# Altium project ASCII-v1.2.PrjPcb (part 1 of 3)
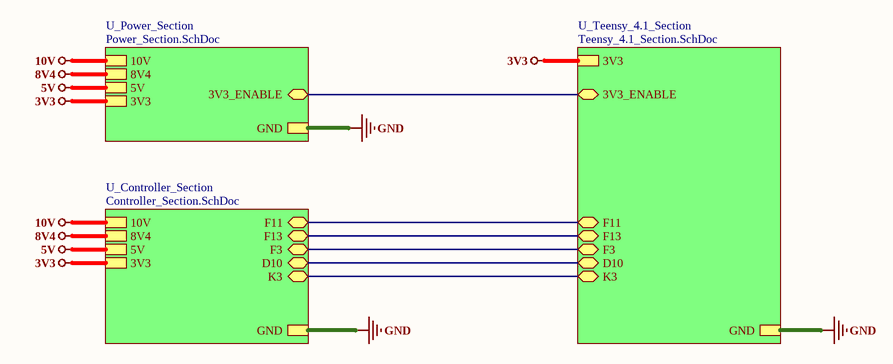
[diagram p0: Top_Section.SchDoc]
4 sheets, 189 parts. Net scope: hierarchical (ports join the sheet entries above them; power ports are global).
Board file: ASCII-v1.2.PcbDoc
Sheets:
  Top_Section.SchDoc
    U_Power_Section = Power_Section.SchDoc
    U_Controller_Section = Controller_Section.SchDoc
    U_Teensy_4.1_Section = Teensy_4.1_Section.SchDoc

## Sheet Top_Section.SchDoc
size 420 x 297 mm; SheetNumber: 1; SheetTotal: 4

### Sub-sheets
U_Controller_Section = Controller_Section.SchDoc: 8V4, GND, 10V, 5V, 3V3, F11 (bidir), F13 (bidir), F3 (bidir), D10 (bidir), K3 (bidir)
U_Power_Section = Power_Section.SchDoc: 8V4, GND, 10V, 5V, 3V3, 3V3_ENABLE (bidir)
U_Teensy_4.1_Section = Teensy_4.1_Section.SchDoc: GND, 3V3, 3V3_ENABLE (bidir), F11 (bidir), F13 (bidir), F3 (bidir), D10 (bidir), K3 (bidir)

### Nets
3V3: sheet U_Power_Section/3V3, sheet U_Controller_Section/3V3, sheet U_Teensy_4.1_Section/3V3
5V: sheet U_Power_Section/5V, sheet U_Controller_Section/5V
8V4: sheet U_Power_Section/8V4, sheet U_Controller_Section/8V4
10V: sheet U_Power_Section/10V, sheet U_Controller_Section/10V  [project net S-]
GND: sheet U_Power_Section/GND, sheet U_Controller_Section/GND, sheet U_Teensy_4.1_Section/GND
3V3_ENABLE: sheet U_Power_Section/3V3_ENABLE, sheet U_Teensy_4.1_Section/3V3_ENABLE
D10: sheet U_Controller_Section/D10, sheet U_Teensy_4.1_Section/D10
F3: sheet U_Controller_Section/F3, sheet U_Teensy_4.1_Section/F3
F11: sheet U_Controller_Section/F11, sheet U_Teensy_4.1_Section/F11
F13: sheet U_Controller_Section/F13, sheet U_Teensy_4.1_Section/F13
K3: sheet U_Controller_Section/K3, sheet U_Teensy_4.1_Section/K3

### Notes on the sheet
- File:
- Title:
- Date:
- Page
- Num:
- Total:
- Drawn By: Huzaifa Ali

## Sheet Power_Section.SchDoc
size 420 x 297 mm; SheetNumber: 3; SheetTotal: 4
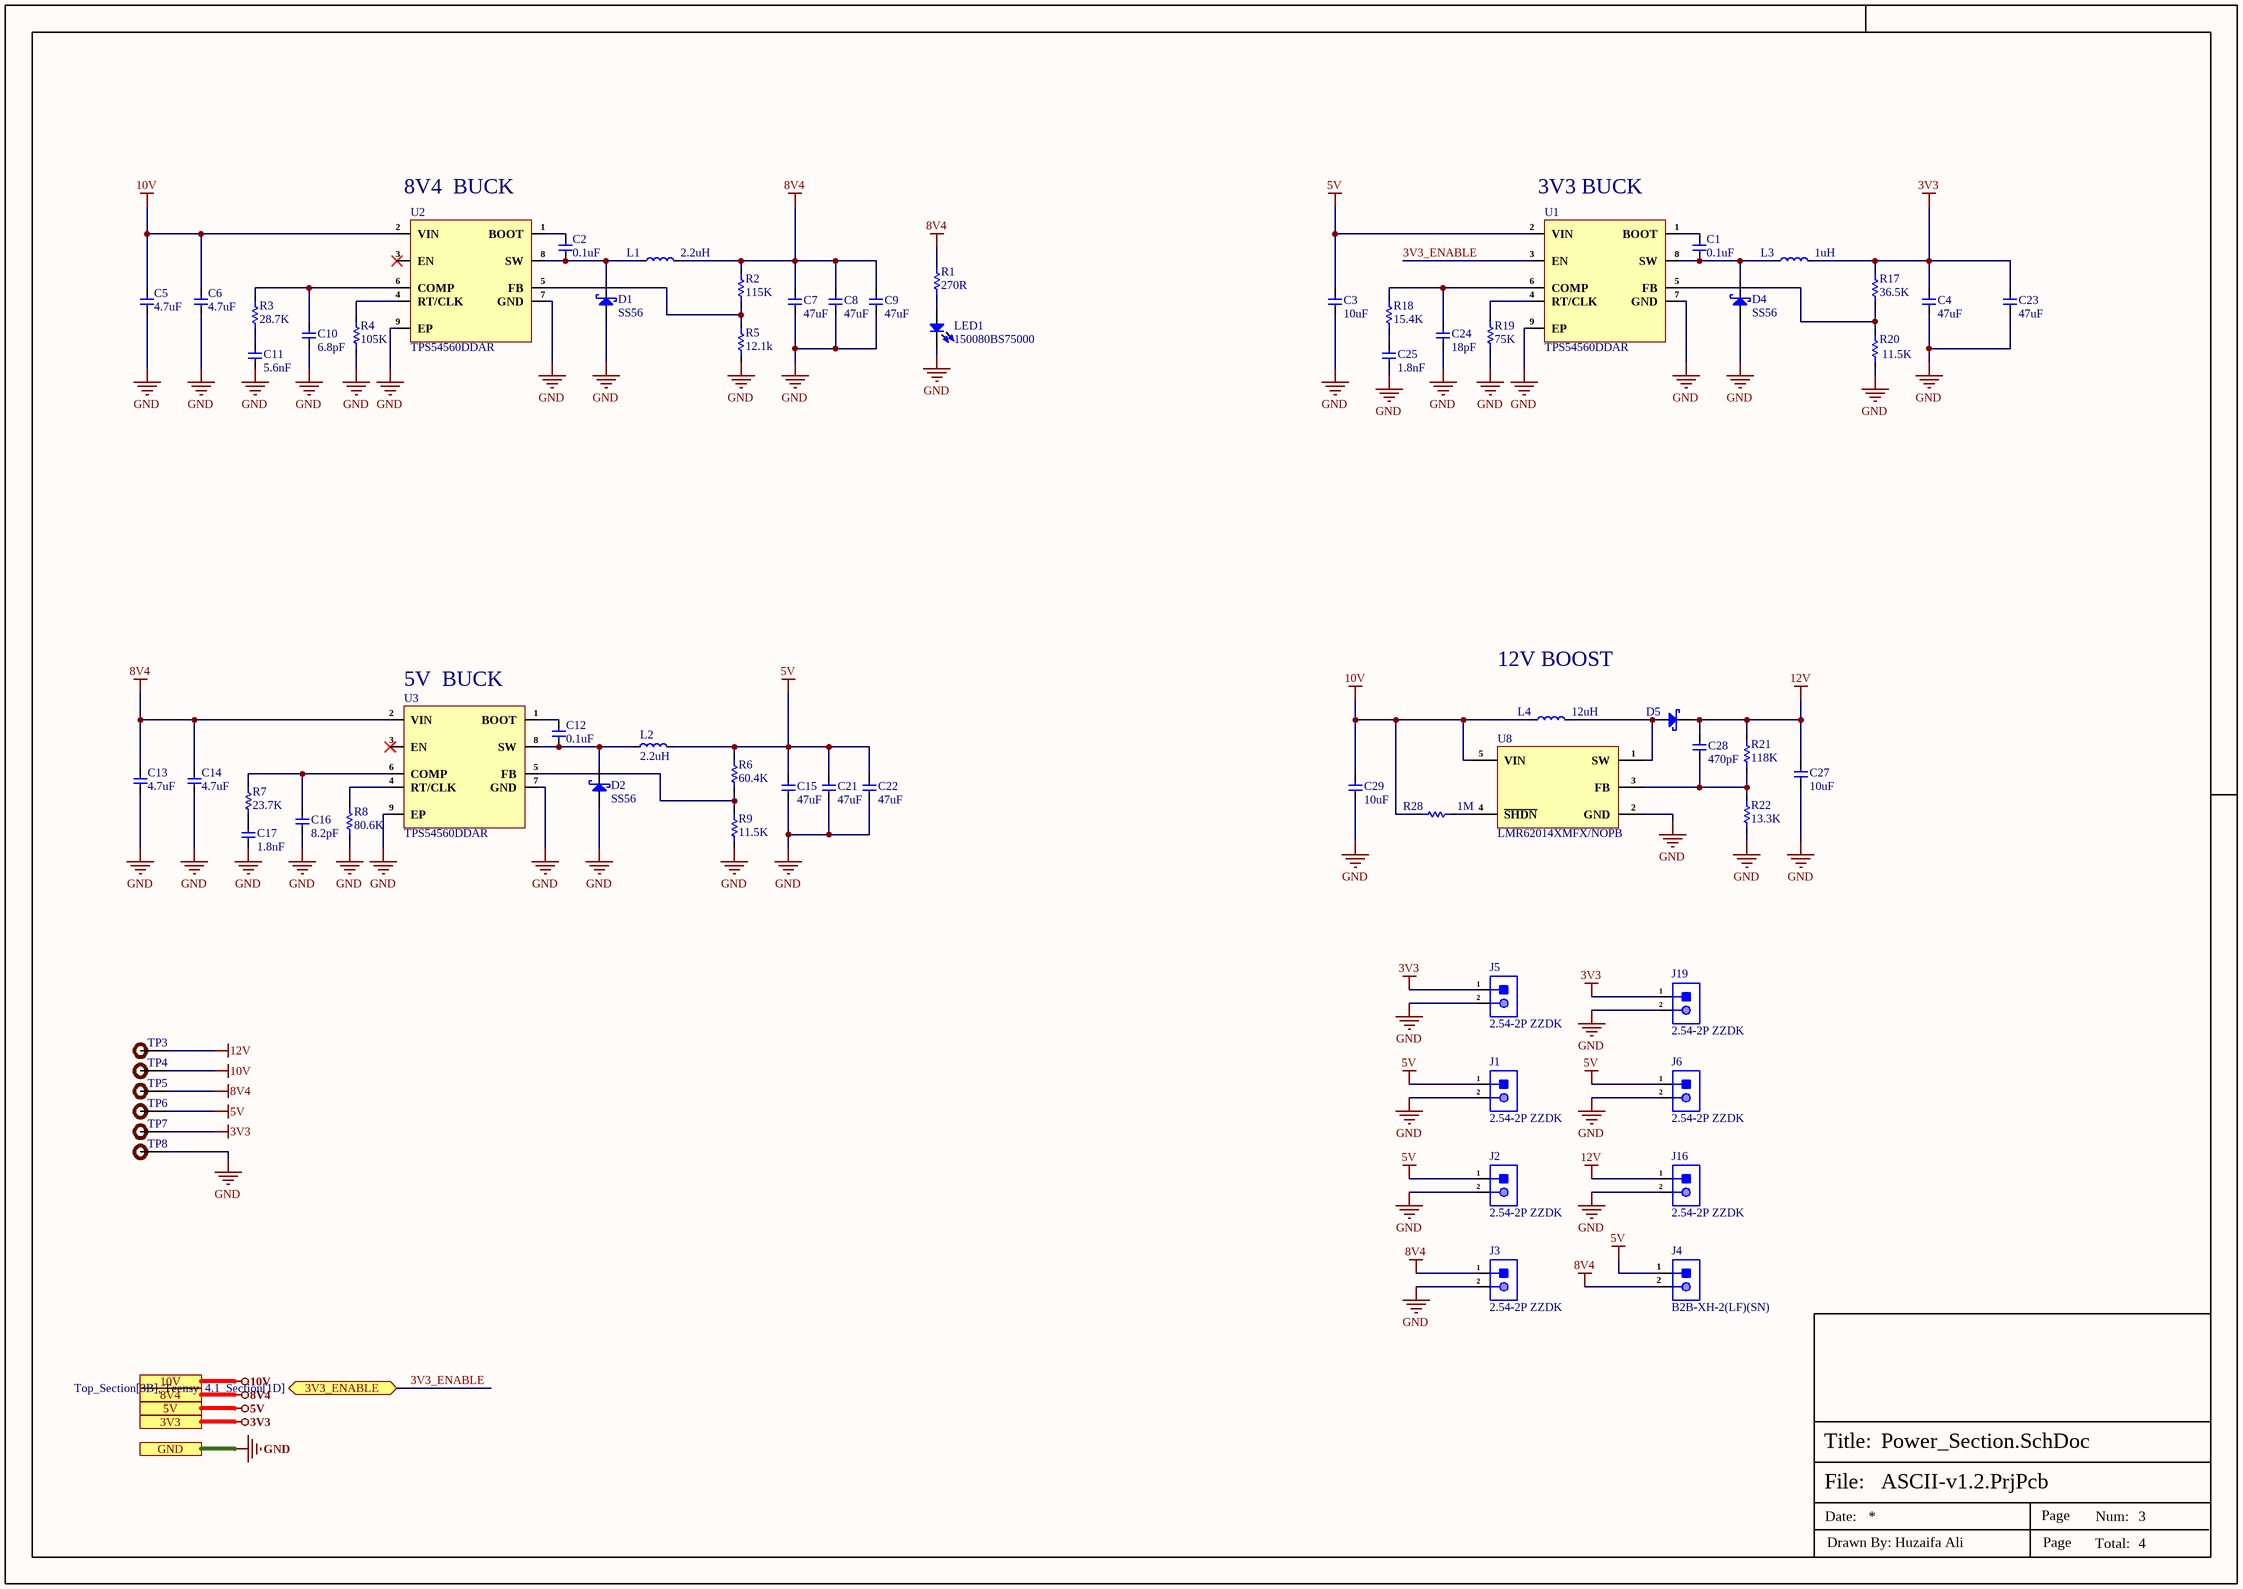
[diagram p1: Power_Section.SchDoc]

### Parts
C1  0.1uF  [Cap-0402]
C2  0.1uF  [Cap-0402]
C3  10uF  [Cap-0603]
C4  47uF  [Cap-1206]
C5  4.7uF  [Cap-0402]
C6  4.7uF  [Cap-0402]
C7  47uF  [Cap-1206]
C8  47uF  [Cap-1206]
C9  47uF  [Cap-1206]
C10  6.8pF  [Cap-0402]
C11  5.6nF  [Cap-0402]
C12  0.1uF  [Cap-0402]
C13  4.7uF  [Cap-0402]
C14  4.7uF  [Cap-0402]
C15  47uF  [Cap-1206]
C16  8.2pF  [Cap-0402]
C17  1.8nF  [Cap-0402]
C21  47uF  [Cap-1206]
C22  47uF  [Cap-1206]
C23  47uF  [Cap-1206]
C24  18pF  [Cap-0603]
C25  1.8nF  [Cap-0402]
C27  10uF  [Cap-0603]
C28  470pF  [Cap-0603]
C29  10uF  [Cap-0603]
D1  SS56  [SMA]
D2  SS56  [SMA]
D4  SS56  [SMA]
D5  PMEG3010ER,115  [SOD-123W]  (value not drawn)
J1  2.54-2P ZZDK  [2.54-2P ZZDK]
J2  2.54-2P ZZDK  [2.54-2P ZZDK]
J3  2.54-2P ZZDK  [2.54-2P ZZDK]
J4  B2B-XH-2(LF)(SN)  [B2B-XH-2(LF)(SN)]
J5  2.54-2P ZZDK  [2.54-2P ZZDK]
J6  2.54-2P ZZDK  [2.54-2P ZZDK]
J16  2.54-2P ZZDK  [2.54-2P ZZDK]
J19  2.54-2P ZZDK  [2.54-2P ZZDK]
L1  2.2uH  [PSPMAA0503-2R2M-ANP]
L2  2.2uH  [PSPMAA0503-2R2M-ANP]
L3  1uH  [SRN8040-1R0Y]
L4  12uH  [SMTDR54-120M]
LED1  150080BS75000  [LED-0805]
R1  270R  [Res-0603]
R2  115K  [Res-0402]
R3  28.7K  [Res-0402]
R4  105K  [Res-0402]
R5  12.1k  [Res-0402]
R6  60.4K  [Res-0402]
R7  23.7K  [Res-0402]
R8  80.6K  [Res-0402]
R9  11.5K  [Res-0402]
R17  36.5K  [Res-0603]
R18  15.4K  [Res-0603]
R19  75K  [Res-0603]
R20  11.5K  [Res-0402]
R21  118K  [Res-0402]
R22  13.3K  [Res-0603]
R28  1M  [Res-0603]
TP3  TEST POINT  [Test-point]  (value not drawn)  (no BOM)
TP4  TEST POINT  [Test-point]  (value not drawn)  (no BOM)
TP5  TEST POINT  [Test-point]  (value not drawn)  (no BOM)
TP6  TEST POINT  [Test-point]  (value not drawn)  (no BOM)
TP7  TEST POINT  [Test-point]  (value not drawn)  (no BOM)
TP8  TEST POINT  [Test-point]  (value not drawn)  (no BOM)
U1  TPS54560DDAR  [8-SO PowerPad]
U2  TPS54560DDAR  [8-SO PowerPad]
U3  TPS54560DDAR  [8-SO PowerPad]
U8  LMR62014XMFX/NOPB  [SOT-23-5]

### Ports
3V3 (see Top_Section[3B], Controller_Section[5D], Teensy_4.1_Section[2D]), 3V3_ENABLE (bidir, see Top_Section[3B], Teensy_4.1_Section[1D]), 5V (see Top_Section[3B], Controller_Section[5D]), 8V4 (see Top_Section[3B], Controller_Section[5D]), 10V (see Top_Section[3B], Controller_Section[5D]), GND (see Top_Section[3B], Controller_Section[5D], Teensy_4.1_Section[2D])

### Nets
3V3: C4.2 C23.2 J5.1 J19.1 L3.2 R17.2 TP7.1 ; port 3V3
5V: C3.2 C15.2 C21.2 C22.2 J1.1 J2.1 J4.1 J6.1 L2.2 R6.2 TP6.1 U1.2(VIN) ; port 5V
8V4: C7.2 C8.2 C9.2 C13.2 C14.2 J3.1 J4.2 L1.2 R1.2 R2.2 TP5.1 U3.2(VIN) ; port 8V4
10V: C5.2 C6.2 C29.2 L4.1 R28.2 TP4.1 U2.2(VIN) U8.5(VIN) ; port 10V  [project net S-]
12V: C27.2 C28.2 D5.2(K) J16.1 R21.2 TP3.1
GND: C3.1 C4.1 C5.1 C6.1 C7.1 C8.1 C9.1 C10.1 C11.1 C13.1 C14.1 C15.1 C16.1 C17.1 C21.1 C22.1 C23.1 C24.1 C25.1 C27.1 C29.1 D1.2(A) D2.2(A) D4.2(A) J1.2 J2.2 J3.2 J5.2 J6.2 J16.2 J19.2 LED1.2 R4.1 R5.1 R8.1 R9.1 R19.1 R20.1 R22.1 TP8.1 U1.7(GND) U1.9(EP) U2.7(GND) U2.9(EP) U3.7(GND) U3.9(EP) U8.2(GND) ; port GND
3V3_ENABLE: U1.3(EN) ; port 3V3_ENABLE
NetC1_1: C1.1 D4.1(K) L3.1 U1.8(SW)
NetC1_2: C1.2 U1.1(BOOT)
NetC2_1: C2.1 D1.1(K) L1.1 U2.8(SW)
NetC2_2: C2.2 U2.1(BOOT)
NetC10_2: C10.2 R3.1 U2.6(COMP)
NetC11_2: C11.2 R3.2
NetC12_1: C12.1 D2.1(K) L2.1 U3.8(SW)
NetC12_2: C12.2 U3.1(BOOT)
NetC16_2: C16.2 R7.2 U3.6(COMP)
NetC17_2: C17.2 R7.1
NetC24_2: C24.2 R18.2 U1.6(COMP)
NetC25_2: C25.2 R18.1
NetC28_1: C28.1 R21.1 R22.2 U8.3(FB)
NetD5_1: D5.1(A) L4.2 U8.1(SW)
NetLED1_1: LED1.1 R1.1
NetR2_1: R2.1 R5.2 U2.5(FB)
NetR4_2: R4.2 U2.4(RT/CLK)
NetR6_1: R6.1 R9.2 U3.5(FB)
NetR8_2: R8.2 U3.4(RT/CLK)
NetR17_1: R17.1 R20.2 U1.5(FB)
NetR19_2: R19.2 U1.4(RT/CLK)
NetR28_1: R28.1 U8.4(~{SHDN})

Not connected (* = marked no-connect by the designer): U2 3(EN)*; U3 3(EN)*

### Notes on the sheet
- (near U2) 8V4  BUCK
- (near U1) 3V3 BUCK
- (near L4) 12V BOOST
- (near U3) 5V  BUCK
- File:
- Title:
- Date:
- Page
- Num:
- Total:
- Drawn By: Huzaifa Ali

### Library data of the parts
C1 C2 C12 = CC0402KRX7R8BB104: CAP CER 0.1UF 25V X7R 0402; Manufacturer: Yageo; Tolerance: 10%; Capacitance: 100nF; Dissipation Factor: 3.5%; Supplier 1: Digi-Key; Manufacturer Part Number: CC0402KRX7R8BB104; RoHS: Yes; Category: Ceramic Capacitors; Stock 1: 1841009; Pricing 1: 1=0.10000, 10=0.03100, 50=0.01700, 100=0.01390, 500=0.00990, 1000=0.00777, 2500=0.00707, 5000=0.00650 (USD); Mount: Surface Mount; Case/Package: 0402; Case Code (Imperial): 0402; Case Code (Metric): 1005; Min Operating Temperature: -55°C; Max Operating Temperature: 125°C; Dielectric: X7R; Voltage Rating: 25V; Voltage Rating (DC): 25V; Packaging: Tape and Reel; Termination: SMD/SMT; Resistor Type: Ceramic; Length: 1mm; Width: 0.02inch; Height: 0.5mm; Thickness: 0.022inch; Depth: 0.5mm; Radiation Hardening: No; Lead Free: Lead Free; Halogen Free: Halogen Free; ComponentLink1URL: https://datasheet.ciiva.com/11464/upy-gphc-x7r-6-3v-to-50v-8-11464889.pdf?src-supplier=Avnet; ComponentLink1Description: https://datasheet.ciiva.com/11464/upy-gphc-x7r-6-3v-to-50v-8-11464889.pdf?src-supplier=Avnet; ComponentLink2URL: https://datasheet.ciiva.com/13210/upy-gphc-x7r-6-3v-to-50v-8-12304-13210908.pdf?src-supplier=Mouser; ComponentLink2Description: https://datasheet.ciiva.com/13210/upy-gphc-x7r-6-3v-to-50v-8-12304-13210908.pdf?src-supplier=Mouser; ComponentLink3URL: https://datasheet.ciiva.com/17437/upy-gphc-x7r-6-3v-to-50v-8-17437357.pdf?src-supplier=Avnet+Europe; ComponentLink3Description: https://datasheet.ciiva.com/17437/upy-gphc-x7r-6-3v-to-50v-8-17437357.pdf?src-supplier=Avnet+Europe; Supplier Part Number 1: 311-2077-1-ND; LCSC Part Number: C105883
C3 C27 C29 = CL10A106MA8NRNC: CAP CER 10UF 25V X5R 0603; Manufacturer: Samsung; Tolerance: 20%; Supplier 1: Avnet; Manufacturer Part Number: CL10A106MA8NRNC; RoHS: Yes; Category: Ceramic Capacitors; Pricing 1: 4000=0.03753, 8000=0.03700, 16000=0.03595, 24000=0.03515, 32000=0.03383, 40000=0.03304, 400000=0.03225 (USD); Mount: Surface Mount; Case/Package: 0603; Case Code (Metric): 1608; Case Code (Imperial): 0603; Contact Plating: Tin; Min Operating Temperature: -55°C; Max Operating Temperature: 85°C; Package Quantity: 1; Packaging: Tape and Reel; Capacitance: 10uF; Voltage Rating: 25V; Dielectric: X5R; Termination: Wraparound; Series: CL; Construction: Flat; Length: 0.063inch; Width: 0.031inch; Thickness: 0.035inch; Lead Free: Lead Free; RoHS Compliant: Yes; ComponentLink1URL: https://datasheet.ciiva.com/25766/cl10a106ma8nrnc-25766562.pdf?src-supplier=Digi-Key; ComponentLink1Description: https://datasheet.ciiva.com/25766/cl10a106ma8nrnc-25766562.pdf?src-supplier=Digi-Key; Supplier Part Number 1: CL10A106MA8NRNC; LCSC Part Number: C96446
C4 C7-C9 C15 C21-C23 = GRM31CR61E476ME44L: CAP CER 47UF 25V X5R 1206; Manufacturer: Murata; Tolerance: 20%; Item Type: Capacitor; Supplier 1: Digi-Key; Manufacturer Part Number: GRM31CR61E476ME44L; RoHS: Yes; Category: Ceramic Capacitors; Capacitance: 47uF; Voltage Rating (DC): 25V; Dielectric: X5R; Length: 3.2mm; Width: 1.6mm; Thickness: 1.6mm; ComponentLink1URL: https://search.murata.co.jp/Ceramy/image/img/A01X/partnumbering_e_01.pdf?src-supplier=Digi-Key; ComponentLink1Description: https://search.murata.co.jp/Ceramy/image/img/A01X/partnumbering_e_01.pdf?src-supplier=Digi-Key; Supplier Part Number 1: 490-16268-2-ND; LCSC Part Number: C403725
C5 C6 C13 C14 = CGA0402X5R475M250GT: 25V 4.7uF X5R ±20% 0402 Multilayer Ceramic Capacitors MLCC - SMD/SMT ROHS; Manufacturer: HRE; ComponentLink1Description: LCSC; ComponentLink1URL: https://www.lcsc.com/product-detail/Multilayer-Ceramic-Capacitors-MLCC-SMD-SMT_HRE-CGA0402X5R475M250GT_C6119795.html; Manufacturer Part Number: CGA0402X5R475M250GT; Footprint: 0402; Value: 4.7uF; LCSC Part Number: C6119795; Item Type: Capacitor
C10 = CC0402CRNPO9BN6R8: CAP CER 6.8PF 50V C0G/NPO 0402; Manufacturer: Yageo; Dielectric: C0G; Tolerance: 2%; Insulation Resistance: 10GR; Item Type: Capacitor; Supplier: Future Electronics; Supplier Part Number: 3247368; Manufacturer Part Number: CC0402CRNPO9BN6R8; RoHS: Yes; Category: Ceramic Capacitors; Stock: 200000; Pricing: 10000=0.0024, 40000=0.0022, 150000=0.0021, 400000=0.002, 1000000=0.0019 (USD); Mounting Technology: Surface Mount; Case/Package: 0402; Case Code (Imperial): 0402; Case Code (Metric): 1005; Weight: 2.3E-05oz; Min Operating Temperature: -55°C; Max Operating Temperature: 125°C; Value: 6.8pF; Packaging: Tape and Reel; Voltage Rating: 50V; Voltage Rating (DC): 50V; Termination: SMD/SMT; Series: CC; Construction: Flat; Length: 1mm; Width: 0.5mm; Height: 0.5mm; Depth: 0.5mm; Radiation Hardening: No; RoHS Compliant: Yes; ComponentLink1URL: https://datasheet.ciiva.com/11587/upy-gp-np0-16v-to-50v-8-11587182.pdf?src-supplier=Avnet; ComponentLink1Description: https://datasheet.ciiva.com/11587/upy-gp-np0-16v-to-50v-8-11587182.pdf?src-supplier=Avnet; LCSC Part Number: C189470
C11 = CC0402KRX7R9BB562: CAP CER 5600PF 50V X7R 0402; Manufacturer: Yageo; Item Type: Capacitors; Material: 4241ConductorMaterial; Temperature Coefficient: 30ppm/°C; Supplier: Future Electronics; LCSC Part Number: C281760; Manufacturer Part Number: CC0402KRX7R9BB562; RoHS: Yes; Stock: 120000; Pricing: 10000=0.0029, 40000=0.0028, 150000=0.0027, 300000=0.0026, 750000=0.0025 (USD); Height: 550um; Lead Free: 5697LeadFree; Halogen Free: 5694HalogenFree; ComponentLink1URL: https://datasheet.ciiva.com/26862/getdatasheetpartid-403477-26862651.pdf?src-supplier=Verical; ComponentLink1Description: https://datasheet.ciiva.com/26862/getdatasheetpartid-403477-26862651.pdf?src-supplier=Verical; ComponentLink2URL: https://datasheet.ciiva.com/11586/upy-gphc-x7r-6-3v-to-50v-8-11586494.pdf?src-supplier=Avnet; ComponentLink2Description: https://datasheet.ciiva.com/11586/upy-gphc-x7r-6-3v-to-50v-8-11586494.pdf?src-supplier=Avnet
C16 = CC0402DRNPO9BN8R2: CAP CER 8.2PF 50V C0G/NPO 0402; Manufacturer: Yageo; Item Type: Capacitor; Supplier: Future Electronics; Supplier Part Number: 2138063; Manufacturer Part Number: CC0402DRNPO9BN8R2; RoHS: Yes; Category: Ceramic Capacitors; Stock: 120000; Pricing: 10000=0.0024, 40000=0.0022, 150000=0.0021, 400000=0.002, 1000000=0.0019 (USD); ComponentLink1URL: https://datasheet.ciiva.com/144/mlccorderingcode-144589.pdf?src-supplier=Digikey; ComponentLink1Description: https://datasheet.ciiva.com/144/mlccorderingcode-144589.pdf?src-supplier=Digikey; ComponentLink2URL: https://datasheet.ciiva.com/144/mlccorderingcode-144590.pdf?src-supplier=Digikey; ComponentLink2Description: https://datasheet.ciiva.com/144/mlccorderingcode-144590.pdf?src-supplier=Digikey; ComponentLink3URL: https://datasheet.ciiva.com/144/mlccorderingcode-144591.pdf?src-supplier=Digikey; ComponentLink3Description: https://datasheet.ciiva.com/144/mlccorderingcode-144591.pdf?src-supplier=Digikey; ComponentLink4URL: https://datasheet.ciiva.com/13208/upy-gp-np0-16v-to-50v-8-13208987.pdf?src-supplier=Mouser; ComponentLink4Description: https://datasheet.ciiva.com/13208/upy-gp-np0-16v-to-50v-8-13208987.pdf?src-supplier=Mouser; ComponentLink5URL: https://datasheet.ciiva.com/11587/upy-gp-np0-16v-to-50v-8-11587051.pdf?src-supplier=Avnet; ComponentLink5Description: https://datasheet.ciiva.com/11587/upy-gp-np0-16v-to-50v-8-11587051.pdf?src-supplier=Avnet; LCSC Part Number: C327412
C17 C25 = CC0402KRX7R9BB182: 50V 1.8nF X7R ±10% 0402 Multilayer Ceramic Capacitors MLCC - SMD/SMT ROHS; Manufacturer: YAGEO; Manufacturer Part Number: CC0402KRX7R9BB182; Package: 0402; LCSC Part Number: C107024; Item Type: Capacitor; ComponentLink1Description: LCSC; ComponentLink1URL: https://www.lcsc.com/product-detail/Multilayer-Ceramic-Capacitors-MLCC-SMD-SMT_YAGEO-CC0402KRX7R9BB182_C107024.html
C24 = CL10C180JB8NNNC: CAP CER 18PF 50V C0G/NP0 0603; Manufacturer: Samsung; Material: Ceramic; Tolerance: 5%; Dielectric: C0G; Temperature Coefficient: 300ppm/°C; Supplier 1: Arrow Electronics; Manufacturer Part Number: CL10C180JB8NNNC; RoHS: Yes; Category: Ceramic Capacitors; Stock 1: 1828000; Pricing 1: 4000=0.00360, 8000=0.00210 (USD); Mount: Surface Mount; Case/Package: 0603; Case Code (Metric): 1608; Case Code (Imperial): 0603; Contact Plating: Tin; Min Operating Temperature: -55°C; Max Operating Temperature: 125°C; Capacitance: 18pF; Voltage: 50V; Packaging: Tape and Reel; Voltage Rating: 50V; Series: CL; Construction: Flat; Length: 1.6mm; Width: 0.031inch; Height: 0.8mm; Depth: 0.8mm; Thickness: 0.035inch; Radiation Hardening: No; RoHS Compliant: Yes; ComponentLink1URL: https://datasheet.ciiva.com/25709/cl10c180jb8nnnc-25709670.pdf?src-supplier=Digi-Key; ComponentLink1Description: https://datasheet.ciiva.com/25709/cl10c180jb8nnnc-25709670.pdf?src-supplier=Digi-Key; ComponentLink2URL: https://datasheet.ciiva.com/26838/getdatasheetpartid-660083-26838496.pdf?src-supplier=Verical; ComponentLink2Description: https://datasheet.ciiva.com/26838/getdatasheetpartid-660083-26838496.pdf?src-supplier=Verical; ComponentLink3URL: https://datasheet.ciiva.com/29198/457219-da-01-en-vs-kondensator-0603-29198763.pdf?src-supplier=Conrad; ComponentLink3Description: https://datasheet.ciiva.com/29198/457219-da-01-en-vs-kondensator-0603-29198763.pdf?src-supplier=Conrad; ComponentLink4URL: https://datasheet.ciiva.com/26310/mlcc-catalogdownload2013-eng-26310310.pdf?src-supplier=Distrelec; ComponentLink4Description: https://datasheet.ciiva.com/26310/mlcc-catalogdownload2013-eng-26310310.pdf?src-supplier=Distrelec; Supplier Part Number 1: CL10C180JB8NNNC
C28 = 0603B471K500CT: CAP CER 470PF 50V X7R 0603; Manufacturer: Walsin Technologies; Tolerance: 10%; Item Type: Capacitor; Supplier 1: Arrow Electronics; Manufacturer Part Number: 0603B471K500CT; RoHS: Yes; Category: Ceramic Capacitors; Stock 1: 136000; Pricing 1: 4000=0.00550, 8000=0.00460, 12000=0.00440, 40000=0.00430 (USD); Case/Package: Ceramic; Case Code (Metric): 1608; Case Code (Imperial): 0603; Min Operating Temperature: -55°C; Max Operating Temperature: 125°C; Capacitance: 470pF; Packaging: Tape and Reel; Dielectric: X7R; Voltage Rating: 50V; Voltage Rating (DC): 50V; Length: 1.6mm; Depth: 0.8mm; Radiation Hardening: No; RoHS Compliant: Yes; REACH SVHC: Unknown; Lead Free: Lead Free; ComponentLink1URL: https://www.verical.com/server-webapp/html/getDatasheet?partID=467798&src-supplier=Verical; ComponentLink1Description: https://www.verical.com/server-webapp/html/getDatasheet?partID=467798&src-supplier=Verical; ComponentLink2URL: http://www.farnell.com/datasheets/2340522.pdf?src-supplier=Farnell; ComponentLink2Description: http://www.farnell.com/datasheets/2340522.pdf?src-supplier=Farnell; ComponentLink3URL: http://www.passivecomponent.com/indexsea/0603B471K500CT-IS.pdf?src-supplier=Digi-Key; ComponentLink3Description: http://www.passivecomponent.com/indexsea/0603B471K500CT-IS.pdf?src-supplier=Digi-Key; ComponentLink4URL: http://www.passivecomponent.com/wp-content/uploads/2018/10/MLCC.pdf?src-supplier=Digi-Key; ComponentLink4Description: http://www.passivecomponent.com/wp-content/uploads/2018/10/MLCC.pdf?src-supplier=Digi-Key; ComponentLink5URL: http://www.farnell.com/datasheets/1958513.pdf?src-supplier=Element14; ComponentLink5Description: http://www.farnell.com/datasheets/1958513.pdf?src-supplier=Element14; ComponentLink6URL: http://www.farnell.com/datasheets/2340522.pdf?src-supplier=Newark; ComponentLink6Description: http://www.farnell.com/datasheets/2340522.pdf?src-supplier=Newark; Supplier Part Number 1: 0603B471K500CT; LCSC Part Number: C93192
D1 D2 D4 = SS56: DIODE SCHOTTKY 60V 5A SMA; Manufacturer: MDD; LCSC Par Number: C65009; Manufacturer Part Number: SS56; Iterm Type: Diode; ComponentLink1Description: LCSC; ComponentLink1URL: https://www.lcsc.com/product-detail/Schottky-Barrier-Diodes-SBD_MDD-Microdiode-Electronics-SS56_C65009.html
D5 = PMEG3010ER,115: DIODE SCHOTTKY 30V 1A SOD123W; Manufacturer: Nexperia; Supplier 1: Digi-Key; Manufacturer Part Number: PMEG3010ER,115; Stock 1: 72983; Pricing 1: 1=0.35, 10=0.282, 25=0.258, 100=0.162, 250=0.1602, 500=0.15, 1000=0.102 (USD); Supplier Part Number 1: 1727-5201-1-ND; LCSC Part Number: C456106
J1-J3 J5 J6 J16 J19 = 2.54-2P ZZDK: 1x2P 2P XH 1 2.5mm Tin 2 -25℃~+85℃ Brass 3A Direct Insert Plugin,P=2.5mm Wire To Board Connector ROHS; Manufacturer: SHOU HAN; Manufacturer Part Number: 2.54-2P ZZDK; Package: Plugin,P=2.5mm; LCSC Part Number: C18185649; Item Type: Wire To Board Connector; ComponentLink1Description: LCSC; ComponentLink1URL: https://www.lcsc.com/product-detail/Wire-To-Board-Connector_SHOU-HAN-2-54-2P-ZZDK_C18185649.html
J4 = B2B-XH-2(LF)(SN): CONN HEADER VERT 2POS 2.5MM; Manufacturer: JST; Item Type: Headers; Number of Positions: 2; Voltage Rating: 250V; Supplier: Arrow Electronics; LCSC Part Number: B2B-XH-2(LF)(SN); Manufacturer Part Number: B2B-XH-2(LF)(SN); RoHS: Yes; Stock: 480; Pricing: 1=0.0936, 10=0.0911, 25=0.0894, 50=0.0861, 100=0.0835, 1000=0.0764 (USD); Mounting Technology: Through Hole; Contact Material: Brass; Contact Shape: Square; Contact Finish - Mating: TIN; Insulation Material: Nylon; Insulation Color: Natural; Min Operating Temperature: -25°C; Max Operating Temperature: 85°C; Fastening Type: Detent; Series: XH; Packaging: Bulk; Contact Type: Male Pin; Number of Rows: 1; Termination: Press-Fit; Connector Type: Header; Flammability Rating: UL94 V-0
L1 L2 = PSPMAA0503-2R2M-ANP: 5.5A 2.2uH ±20% 7.5A SMD,5.2x5.4x3mm Power Inductors ROHS; Manufacturer: PROD Tech; Manufacturer Part Number: PSPMAA0503-2R2M-ANP; Package: SMD,5.2x5.4x3mm; LCSC Part Number: C436533; Item Type: Inductor; ComponentLink1Description: LCSC; ComponentLink1URL: https://www.lcsc.com/product-detail/Power-Inductors_PROD-Tech-PSPMAA0503-2R2M-ANP_C436533.html
L3 = SRN8040-1R0Y: 7.8A 1uH ±30% 11A SMD,7.9x8.2mm Power Inductors ROHS; Manufacturer: BOURNS; Manufacturer Part Number: SRN8040-1R0Y; Footprint: Custom; ComponentLink1Description: LCSC; ComponentLink1URL: https://www.lcsc.com/product-detail/Power-Inductors_BOURNS-SRN8040-1R0Y_C2041438.html; LCSC Part Number: C2041438
L4 = SMTDR54-120M: 1.4A 12uH ±20% SMD,5.2x5.8mm Power Inductors ROHS; Manufacturer: 3L COILS; Manufacturer Part Number: SMTDR54-120M; Footprint: Custom; ComponentLink1Description: LCSC; ComponentLink1URL: https://www.lcsc.com/product-detail/Power-Inductors_3L-COILS-SMTDR54-120M_C326234.html; Value: 12uH; LCSC Part Number: C326234
LED1 = 150080BS75000: LED BLUE CLEAR 0805 SMD; Manufacturer: Wurth Electronics; Item Type: LEDs; Lens Color: Colorless; Luminous Intensity: 145mcd; Viewing Angle: 140°; Forward Voltage: 3.2V; Wavelength: 470nm; Lens Style: Clear,Flat,Rectangular; Forward Current: 30mA; Test Current: 20mA; Reverse Voltage: 5V; Power Dissipation: 105mW; Lens Size: 1.25mm; Supplier: Digikey; Supplier Part Number: 732-4982-1-ND; Manufacturer Part Number: 150080BS75000; RoHS: Yes; Stock: 93649; Pricing: 1=0.18, 50=0.176, 100=0.151, 500=0.131 (USD); Mounting Technology: Surface Mount; Case/Package: 0805; Color: Blue; Case Code (Metric): 2012; Case Code (Imperial): 0805; Min Operating Temperature: -40°C; Max Operating Temperature: 85°C; Series: WL-SMCW; Package Quantity: 1; Packaging: Cut Tape; Dominant Wavelength: 470nm; Lens Transparency: Clear; Max Reverse Voltage (DC): 5V; Length: 2mm; Width: 1.25mm; Height: 0.8mm; RoHS Compliant: Yes; Reach SVHC Compliant: Unknown; Lead Free: Lead Free; ComponentLink1URL: https://datasheet.ciiva.com/22656/1740214-22656954.pdf?src-supplier=Element14; ComponentLink1Description: https://datasheet.ciiva.com/22656/1740214-22656954.pdf?src-supplier=Element14; ComponentLink2URL: https://datasheet.ciiva.com/23843/150080bs75000-23843251.pdf?src-supplier=Newark; ComponentLink2Description: https://datasheet.ciiva.com/23843/150080bs75000-23843251.pdf?src-supplier=Newark; ComponentLink3URL: https://datasheet.ciiva.com/29279/759433-da-01-en-chipled-0805-w-kl-blau-150080bs75000-29279203.pdf?src-supplier=Conrad; ComponentLink3Description: https://datasheet.ciiva.com/29279/759433-da-01-en-chipled-0805-w-kl-blau-150080bs75000-29279203.pdf?src-supplier=Conrad; ComponentLink4URL: https://datasheet.ciiva.com/29562/150080bs75000-29562923.pdf?src-supplier=Digikey; ComponentLink4Description: https://datasheet.ciiva.com/29562/150080bs75000-29562923.pdf?src-supplier=Digikey; ComponentLink5URL: https://datasheet.ciiva.com/29562/150080bs75000-29562922.pdf?src-supplier=Digikey; ComponentLink5Description: https://datasheet.ciiva.com/29562/150080bs75000-29562922.pdf?src-supplier=Digikey
R1 = RT0603BRE07270RL: RES SMD 270 OHM 0.1% 1/10W 0603; Manufacturer: Yageo; Max Power Dissipation: 100mW; Temperature Coefficient: 50ppm/°C; Voltage Rating (DC): 50V; Item Type: Resistor; Supplier 1: Digi-Key; Manufacturer Part Number: RT0603BRE07270RL; RoHS: Yes; Category: Chip SMD Resistors; Pricing 1: 5000=0.04770 (USD); Case/Package: 0603; Min Operating Temperature: -55°C; Max Operating Temperature: 125°C; Resistance: 270R; Tolerance: 0.1%; Packaging: Tape and Reel; Package Quantity: 5000; Resistor Type: Thin Film; Number of Terminations: 2; Series: RT; Construction: Rectangular; Length: 0.063inch; Width: 0.031inch; Height: 0.022inch; Depth: 0.8mm; Military Standard: Not; Lead Free: Lead Free; RoHS Compliant: Yes; ComponentLink1URL: https://datasheet.ciiva.com/2584/pyu-rt-1-to-0-05-rohs-l-5-2584379.pdf?src-supplier=Digi-Key; ComponentLink1Description: https://datasheet.ciiva.com/2584/pyu-rt-1-to-0-05-rohs-l-5-2584379.pdf?src-supplier=Digi-Key; Supplier Part Number 1: RT0603BRE07270RL-ND; LCSC Part Number: C705836
R2 = CR0402FF1153G: 62.5mW Thick Film Resistors 50V ±1% ±200ppm/℃ 115kΩ 0402 Chip Resistor - Surface Mount ROHS; Manufacturer: LIZ Elec; Manufacturer Part Number: CR0402FF1153G; Package: 0402; LCSC Part Number: C100215; Item Type: Resistor; ComponentLink1Description: LCSC; ComponentLink1URL: https://www.lcsc.com/product-detail/Chip-Resistor-Surface-Mount_LIZ-Elec-CR0402FF1153G_C100215.html
R3 = NQ02WGF2872TCE: 62.5mW 100V ±1% 28.7kΩ 0402 Chip Resistor - Surface Mount ROHS; Manufacturer: Royal Ohm; Supplier: Mouser; Supplier Part Number: 303-NQ02WGF2872TCE; Manufacturer Part Number: NQ02WGF2872TCE; Pricing: 10000=0.002 (USD); LCSC Part Number: C2779810; Item Type: Resistor
R4 = RTT021053FTH: 62.5mW Thick Film Resistors 50V ±100ppm/℃ ±1% 105kΩ 0402 Chip Resistor - Surface Mount ROHS; Manufacturer: RALEC; Manufacturer Part Number: RTT021053FTH; Package: 0402; LCSC Part Number: C102762; Item Type: Resistor; ComponentLink1Description: LCSC; ComponentLink1URL: https://www.lcsc.com/product-detail/Chip-Resistor-Surface-Mount_RALEC-RTT021053FTH_C102762.html
R5 = RT0402BRD0712K1L: RES SMD 12.1KOHM 0.1% 1/16W 0402; Manufacturer: Yageo; Item Type: Resistor; Supplier: Future Electronics; Supplier Part Number: 2068365; Manufacturer Part Number: RT0402BRD0712K1L; RoHS: Yes; Category: Chip SMD Resistors; Stock: 60000; Pricing: 10000=0.0245, 20000=0.0217, 30000=0.0237, 50000=0.0233, 100000=0.0228, 200000=0.022 (USD); ComponentLink1URL: https://datasheet.ciiva.com/12812/pyu-rt-1-to-0-05-rohs-l-4-12812462.pdf?src-supplier=Mouser; ComponentLink1Description: https://datasheet.ciiva.com/12812/pyu-rt-1-to-0-05-rohs-l-4-12812462.pdf?src-supplier=Mouser; LCSC Part Number: C281773
R6 = SCR0402F60K4: 60.4kΩ 50V 62.5mW Thick Film Resistors ±1% 0402 Chip Resistor - Surface Mount ROHS; Manufacturer: VO; Manufacturer Part Number: SCR0402F60K4; Package: 0402; LCSC Part Number: C3016055; Item Type: Resistor; ComponentLink1Description: LCSC; ComponentLink1URL: https://www.lcsc.com/product-detail/Chip-Resistor-Surface-Mount_VO-SCR0402F60K4_C3016055.html
R7 = RT0402BRD0723K7L: RES SMD 23.7KOHM 0.1% 1/16W 0402; Manufacturer: Yageo; Voltage Rating (DC): 50V; Item Type: Resistor; Supplier: Digikey; Supplier Part Number: YAG4212CT-ND; Manufacturer Part Number: RT0402BRD0723K7L; RoHS: Yes; Category: Chip SMD Resistors; Stock: 28530; Pricing: 1=0.16, 10=0.121, 50=0.0958, 100=0.0859, 500=0.0654, 1000=0.0578, 5000=0.04283 (USD); ComponentLink1URL: https://datasheet.ciiva.com/2582/pyu-rt-1-to-0-05-rohs-l-5-2582244.pdf?src-supplier=Digikey; ComponentLink1Description: https://datasheet.ciiva.com/2582/pyu-rt-1-to-0-05-rohs-l-5-2582244.pdf?src-supplier=Digikey; ComponentLink2URL: https://datasheet.ciiva.com/12725/pyu-rt-1-to-0-05-rohs-l-4-12725336.pdf?src-supplier=Mouser; ComponentLink2Description: https://datasheet.ciiva.com/12725/pyu-rt-1-to-0-05-rohs-l-4-12725336.pdf?src-supplier=Mouser; LCSC Part Number: C852656
R8 = CRCW040280K6FKED: RES SMD 80.6K OHM 1% 1/16W 0402; Manufacturer: Vishay Intertech; Item Type: Resistor; Manufacturer Part Number: CRCW040280K6FKED; Package: Res-0402; LCSC Part Number: C2076816
R9 R20 = FRC0402F1152TS: 11.5kΩ 50V 62.5mW Thick Film Resistors ±100ppm/℃ ±1%  0402 Chip Resistor - Surface Mount ROHS; Manufacturer: FOJAN; Manufacturer Part Number: FRC0402F1152TS; Package: 0402; LCSC Part Number: C2933068; Item Type: Resistor; ComponentLink1Description: LCSC; ComponentLink1URL: https://www.lcsc.com/product-detail/Chip-Resistor-Surface-Mount_FOJAN-FRC0402F1152TS_C2933068.html
R17 = RC0603FR-0736K5L: RES 36.5K OHM 1% 1/10W 0603; Manufacturer: YAGEO; Item Type: Resistor; Manufacturer Part Number: RC0603FR-0736K5L; Package: 0603; LCSC Part Number: C137738; ComponentLink1Description: LCSC; ComponentLink1URL: https://www.lcsc.com/product-detail/Chip-Resistor-Surface-Mount_YAGEO-RC0603FR-0736K5L_C137738.html
R18 = RC0603FR-0715K4L: RES 15.4K OHM 1% 1/10W 0603; Manufacturer: Yageo; Item Type: Resistors; Voltage Rating (DC): 50V; Supplier: Future Electronics; LCSC Part Number: C185370; Manufacturer Part Number: RC0603FR-0715K4L; RoHS: Yes; Stock: 230000; Pricing: 5000=0.0022, 50000=0.0021, 150000=0.0021, 375000=0.002, 1000000=0.0019 (USD); Lead Free: 5697LeadFree; RoHS Compliant: 5897YesNo; ComponentLink1URL: https://datasheet.ciiva.com/15159/getdatasheetpartid-28826-15159212.pdf?src-supplier=Verical; ComponentLink1Description: https://datasheet.ciiva.com/15159/getdatasheetpartid-28826-15159212.pdf?src-supplier=Verical; ComponentLink2URL: https://datasheet.ciiva.com/11808/0900766b80f96399-11808544.pdf?src-supplier=Rs; ComponentLink2Description: https://datasheet.ciiva.com/11808/0900766b80f96399-11808544.pdf?src-supplier=Rs; ComponentLink3URL: https://datasheet.ciiva.com/2454/pyu-r-int-thick-7-2454348.pdf?src-supplier=Digikey; ComponentLink3Description: https://datasheet.ciiva.com/2454/pyu-r-int-thick-7-2454348.pdf?src-supplier=Digikey; ComponentLink4URL: https://datasheet.ciiva.com/2454/pyu-r-int-thick-7-2454349.pdf?src-supplier=Digikey; ComponentLink4Description: https://datasheet.ciiva.com/2454/pyu-r-int-thick-7-2454349.pdf?src-supplier=Digikey; ComponentLink5URL: https://datasheet.ciiva.com/2454/pyu-r-int-thick-7-2454350.pdf?src-supplier=Digikey; ComponentLink5Description: https://datasheet.ciiva.com/2454/pyu-r-int-thick-7-2454350.pdf?src-supplier=Digikey
R19 = RC0603FR-0775KL: RES 75K OHM 1% 1/10W 0603; Manufacturer: Yageo; Item Type: Resistor; Value: 75kR; Power Rating: 100mW; Voltage Rating: 50V; Temperature Coefficient: 100ppm/°C; Supplier: Future Electronics; LCSC Part Number: C114636; Manufacturer Part Number: RC0603FR-0775KL; RoHS: Yes; Stock: 550000; Pricing: 5000=0.0015, 75000=0.0015, 250000=0.0014, 750000=0.0013, 2500000=0.0012 (USD); Case/Package: 0603; Pins: 2NUMBER; Case Code (Imperial): 0603; Case Code (Metric): 1608; Min Operating Temperature: -55°C; Max Operating Temperature: 155°C; Tolerance: 1%; Packaging: Tape and Reel; Termination: SMD/SMT; Resistor Type: Thick Film; Number of Terminations: 2; Max Power Dissipation: 100mW; Features: Moisture Resistant; Series: RC; Technology: THICK FILM; Resistance Tolerance: 1%; Construction: Rectangular; Voltage Rating (DC): 50V; Length: 1.6mm; Height: 0.45mm; Depth: 0.8mm; RoHS Compliant: Yes; Reach SVHC Compliant: No; Military Standard: Not; Lead Free: 5697LeadFree; ComponentLink1URL: https://datasheet.ciiva.com/11808/0900766b80f96399-11808100.pdf?src-supplier=Rs; ComponentLink1Description: https://datasheet.ciiva.com/11808/0900766b80f96399-11808100.pdf?src-supplier=Rs; ComponentLink2URL: https://datasheet.ciiva.com/15189/getdatasheetpartid-326733-15189816.pdf?src-supplier=Verical; ComponentLink2Description: https://datasheet.ciiva.com/15189/getdatasheetpartid-326733-15189816.pdf?src-supplier=Verical; ComponentLink3URL: https://datasheet.ciiva.com/2455/pyu-r-int-thick-7-2455324.pdf?src-supplier=Digikey; ComponentLink3Description: https://datasheet.ciiva.com/2455/pyu-r-int-thick-7-2455324.pdf?src-supplier=Digikey; ComponentLink4URL: https://datasheet.ciiva.com/2455/pyu-r-int-thick-7-2455325.pdf?src-supplier=Digikey; ComponentLink4Description: https://datasheet.ciiva.com/2455/pyu-r-int-thick-7-2455325.pdf?src-supplier=Digikey; ComponentLink5URL: https://datasheet.ciiva.com/2455/pyu-r-int-thick-7-2455323.pdf?src-supplier=Digikey; ComponentLink5Description: https://datasheet.ciiva.com/2455/pyu-r-int-thick-7-2455323.pdf?src-supplier=Digikey; ComponentLink6URL: https://datasheet.ciiva.com/46395/443971-46395017.pdf?src-supplier=Element14; ComponentLink6Description: https://datasheet.ciiva.com/46395/443971-46395017.pdf?src-supplier=Element14
R21 = RC0402DR-07118KL: RES 118K OHM 0.5% 1/16W 0402; Manufacturer: Yageo; Resistance: 118kR; Max Power Dissipation: 63mW; Temperature Coefficient: 100ppm/°C; Supplier 1: Mouser; Manufacturer Part Number: RC0402DR-07118KL; RoHS: Yes; Category: Chip SMD Resistors; Pricing 1: 1=0.21000, 10=0.07000, 50=0.07000, 100=0.02900, 1000=0.01300, 10000=0.01200 (USD); Case/Package: 0402; Min Operating Temperature: -55°C; Max Operating Temperature: 155°C; Packaging: Tape and Reel; Resistor Type: Thick Film; Number of Terminations: 2; Tolerance: 0.5%; Features: Moisture Resistant; Length: 0.039inch; Width: 0.02inch; Height: 0.016inch; RoHS Compliant: Yes; ComponentLink1URL: http://www.yageo.com.tw/exep/pages/download/literatures/PYu-R_INT-thick_7.pdf?src-supplier=Digi-Key; ComponentLink1Description: http://www.yageo.com.tw/exep/pages/download/literatures/PYu-R_INT-thick_7.pdf?src-supplier=Digi-Key; Supplier Part Number 1: 603-RC0402DR-07118KL; LCSC Part Number: C723573
R22 = RT0603BRD0713K3L: RES SMD 13.3KOHM 0.1% 1/10W 0603; Manufacturer: Yageo; Resistance: 13.3kR; Power Rating: 100mW; Voltage Rating: 75V; Temperature Coefficient: 25ppm/°C; Voltage Rating (DC): 50V; Item Type: Resistor; Supplier 1: Arrow Electronics; Manufacturer Part Number: RT0603BRD0713K3L; RoHS: Yes; Category: Chip SMD Resistors; Stock 1: 4750; Pricing 1: 1=0.29220, 10=0.24060, 25=0.23820, 100=0.10400, 250=0.10250, 500=0.10060, 1000=0.06040, 3000=0.04000 (USD); Case/Package: 0603; Case Code (Metric): 1608; Case Code (Imperial): 0603; Contact Plating: Tin,Matte; Min Operating Temperature: -55°C; Max Operating Temperature: 125°C; Tolerance: 0.1%; Packaging: Tape and Reel; Package Quantity: 5000; Resistor Type: Thin Film; Termination: SMD/SMT; Number of Terminations: 2; Max Power Dissipation: 100mW; Features: Moisture Resistant; Series: RT; Construction: Rectangular; Length: 0.063inch; Width: 0.031inch; Height: 0.022inch; Depth: 0.8mm; Radiation Hardening: No; Military Standard: Not; Lead Free: Lead Free; RoHS Compliant: Yes; ComponentLink1URL: https://datasheet.ciiva.com/12725/pyu-rt-1-to-0-05-rohs-l-4-12725067.pdf?src-supplier=Mouser; ComponentLink1Description: https://datasheet.ciiva.com/12725/pyu-rt-1-to-0-05-rohs-l-4-12725067.pdf?src-supplier=Mouser; ComponentLink2URL: https://datasheet.ciiva.com/8890/pyu-rt-1-to-0-05-rohs-l-4-8890934.pdf?src-supplier=Avnet; ComponentLink2Description: https://datasheet.ciiva.com/8890/pyu-rt-1-to-0-05-rohs-l-4-8890934.pdf?src-supplier=Avnet; ComponentLink3URL: https://datasheet.ciiva.com/2585/pyu-rt-1-to-0-05-rohs-l-4-2585661.pdf?src-supplier=Digi-Key; ComponentLink3Description: https://datasheet.ciiva.com/2585/pyu-rt-1-to-0-05-rohs-l-4-2585661.pdf?src-supplier=Digi-Key; ComponentLink4URL: https://datasheet.ciiva.com/46635/pyu-rt-1-to-0-05-rohs-l-5-46635007.pdf?src-supplier=Digi-Key; ComponentLink4Description: https://datasheet.ciiva.com/46635/pyu-rt-1-to-0-05-rohs-l-5-46635007.pdf?src-supplier=Digi-Key; LCSC Part Number: C861117; Supplier Part Number 1: RT0603BRD0713K3L; Value: 13.3K
R28 = RC0603FR-071ML: RES SMD 1M OHM 1% 1/10W 0603; Manufacturer: Yageo; Voltage Rating: 50V; Resistance: 1MR; Power Rating: 100mW; Temperature Coefficient: 100ppm/°C; Item Type: Resistor; Supplier 1: Digi-Key; Manufacturer Part Number: RC0603FR-071ML; Stock 1: 3824601; Pricing 1: 1=0.1, 10=0.023, 100=0.0094, 1000=0.00421, 2500=0.00366 (USD); Case/Package: 0603; Number of Pins: 2; Case Code (Imperial): 0603; Case Code (Metric): 1608; Min Operating Temperature: -55°C; Max Operating Temperature: 155°C; Voltage Rating (DC): 50V; Tolerance: 1%; Packaging: Tape and Reel; Package Quantity: 5000; Termination: SMD/SMT; Composition: Thick Film; Military Standard: Not; Length: 1.6mm; Height: 0.45mm; Width: 0.8mm; Depth: 0.8mm; REACH SVHC: No SVHC; Lead Free: Lead Free; ComponentLink1URL: http://www.farnell.com/datasheets/2167052.pdf?src-supplier=Mouser; ComponentLink1Description: http://www.farnell.com/datasheets/2167052.pdf?src-supplier=Mouser; ComponentLink2URL: http://www.farnell.com/datasheets/2167052.pdf?src-supplier=Element14; ComponentLink2Description: http://www.farnell.com/datasheets/2167052.pdf?src-supplier=Element14; ComponentLink3URL: http://documents.rs-components.com/techlib://itc_doclist_GB.htm?stockno=5048956&src-supplier=RSComponents; ComponentLink3Description: http://documents.rs-components.com/techlib://itc_doclist_GB.htm?stockno=5048956&src-supplier=RSComponents; Supplier Part Number 1: 311-1.00MHRDKR-ND; LCSC Part Number: C105578
TP3-TP8 = TEST POINT: Test Point ON; Item Type: TEST POINT
U1-U3 = TPS54560DDAR: IC REG BCK SPLIT RAIL ADJ 8SOPWR; Manufacturer: Texas Instruments; Item Type: Voltage Regulators - Switching; Supplier: Mouser; Supplier Part Number: 595-TPS54560DDAR; Manufacturer Part Number: TPS54560DDAR; RoHS: Yes; Stock: 12707; Pricing: 1=4.48, 10=3.93, 50=3.93, 100=3.6, 1000=2.75, 10000=2.67 (USD); ComponentLink1URL: https://datasheet.ciiva.com/15082/tps54560-15082015.pdf?src-supplier=Digikey; ComponentLink1Description: https://datasheet.ciiva.com/15082/tps54560-15082015.pdf?src-supplier=Digikey; ComponentLink2URL: https://datasheet.ciiva.com/30031/tps54560-30031578.pdf?src-supplier=Avnet; ComponentLink2Description: https://datasheet.ciiva.com/30031/tps54560-30031578.pdf?src-supplier=Avnet; ComponentLink3URL: https://datasheet.ciiva.com/29739/tps54560-29739549.pdf?src-supplier=Digikey; ComponentLink3Description: https://datasheet.ciiva.com/29739/tps54560-29739549.pdf?src-supplier=Digikey; LCSC Part Number: C31966
U8 = LMR62014XMFX/NOPB: IC REG BOOST ADJ 1.8A SOT23-5; Manufacturer: TI National Semiconductor; Output Voltage: 20V; Min Input Voltage: 2.7V; Number of Outputs: 1; Max Output current: 1.4A; Max Supply Voltage: 14V; Min Output Voltage: 3V; Switching Frequency: 1.6MHz; Synchronous Rectifier: No; Quiescent Current: 2mA; Output Type: Adjustable; Output Configuration: Positive; Supplier 1: Mouser; Manufacturer Part Number: LMR62014XMFX/NOPB; RoHS: Yes; Category: Voltage Regulators - Switching; Stock 1: 7014; Pricing 1: 1=0.96000, 10=0.86100, 50=0.81700, 100=0.67100, 1000=0.43800, 10000=0.39800 (USD); Mounting Technology: Surface Mount; Case/Package: SOT-23-5; Pins: 5; Contact Plating: Tin,Matte; Min Operating Temperature: -40°C; Max Operating Temperature: 125°C; Output Current: 1.8A; Packaging: Tape and Reel; Package Quantity: 3000; Max Output Voltage: 20V; Topology: Boost; Series: SIMPLE SWITCHER®; Radiation Hardening: No; Lead Free: Lead Free; RoHS Compliant: Yes; ComponentLink1URL: http://www.ti.com/lit/ds/symlink/lmr62014.pdf?src-supplier=Farnell; ComponentLink1Description: http://www.ti.com/lit/ds/symlink/lmr62014.pdf?src-supplier=Farnell; ComponentLink2URL: http://www.ti.com/lit/ds/symlink/lmr62014.pdf?src-supplier=Digi-Key; ComponentLink2Description: http://www.ti.com/lit/ds/symlink/lmr62014.pdf?src-supplier=Digi-Key; ComponentLink3URL: http://www.ti.com/lit/gpn/lmr62014?src-supplier=Mouser; ComponentLink3Description: http://www.ti.com/lit/gpn/lmr62014?src-supplier=Mouser; ComponentLink4URL: http://www.ti.com/general/docs/lit/getliterature.tsp?genericPartNumber=LMR62014&&fileType=pdf&src-supplier=Avnet; ComponentLink4Description: http://www.ti.com/general/docs/lit/getliterature.tsp?genericPartNumber=LMR62014&&fileType=pdf&src-supplier=Avnet; ComponentLink5URL: http://components.arrow.com/part/dataview/56704644S382285N1317?src-supplier=Arrow+Electronics; ComponentLink5Description: http://components.arrow.com/part/dataview/56704644S382285N1317?src-supplier=Arrow+Electronics; Supplier Part Number 1: 926-LMR62014XMFXNOPB; LCSC Part Number: C468235; Item Type: IC